# Altium project ESP32IOTProduct.PrjPcb (part 5 of 6)

## Sheet GPIOs_Expander_Relay_Sheet.SchDoc
size A4; SheetNumber: 9; SheetTotal: 10
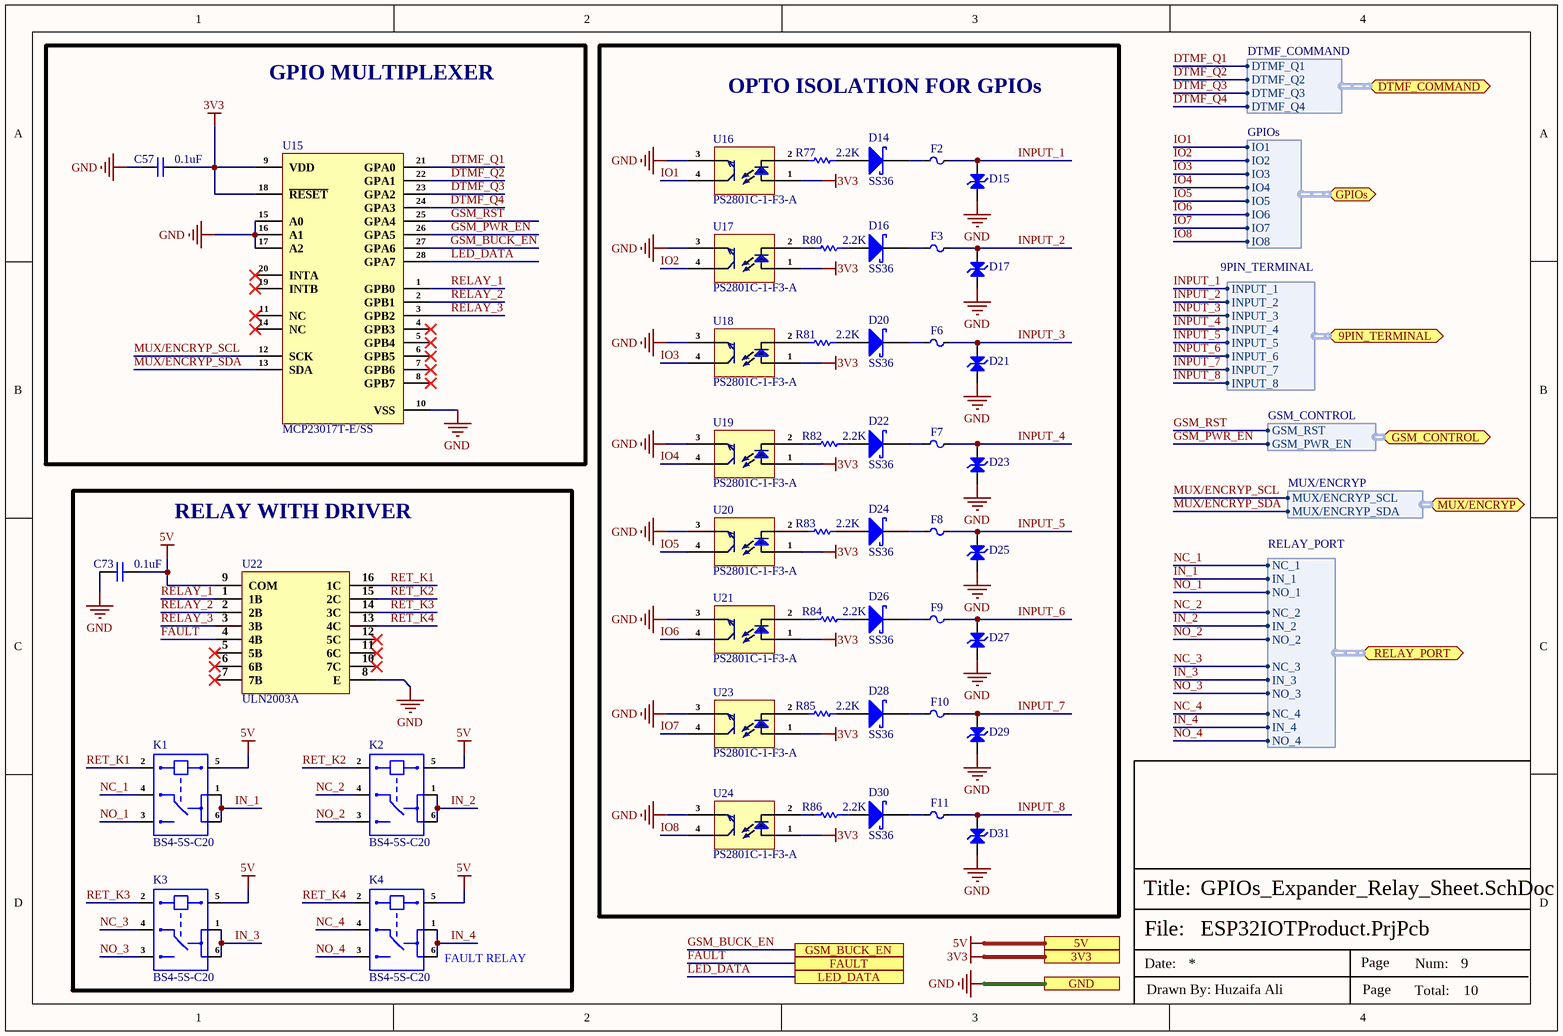
[diagram p8: GPIOs_Expander_Relay_Sheet.SchDoc]

### Parts
C57  0.1uF  [Cap-0603]
C73  0.1uF  [Cap-0603]
D14  SS36  [SMA]
D15  SMBJ36CA  [SMB_]  (value not drawn)
D16  SS36  [SMA]
D17  SMBJ36CA  [SMB_]  (value not drawn)
D20  SS36  [SMA]
D21  SMBJ36CA  [SMB_]  (value not drawn)
D22  SS36  [SMA]
D23  SMBJ36CA  [SMB_]  (value not drawn)
D24  SS36  [SMA]
D25  SMBJ36CA  [SMB_]  (value not drawn)
D26  SS36  [SMA]
D27  SMBJ36CA  [SMB_]  (value not drawn)
D28  SS36  [SMA]
D29  SMBJ36CA  [SMB_]  (value not drawn)
D30  SS36  [SMA]
D31  SMBJ36CA  [SMB_]  (value not drawn)
F2  BSMD1812-150-33V  [Fuse-1812_]  (value not drawn)
F3  BSMD1812-150-33V  [Fuse-1812_]  (value not drawn)
F6  BSMD1812-150-33V  [Fuse-1812_]  (value not drawn)
F7  BSMD1812-150-33V  [Fuse-1812_]  (value not drawn)
F8  BSMD1812-150-33V  [Fuse-1812_]  (value not drawn)
F9  BSMD1812-150-33V  [Fuse-1812_]  (value not drawn)
F10  BSMD1812-150-33V  [Fuse-1812_]  (value not drawn)
F11  BSMD1812-150-33V  [Fuse-1812_]  (value not drawn)
K1  BS4-5S-C20  [BS4-5S-C20]
K2  BS4-5S-C20  [BS4-5S-C20]
K3  BS4-5S-C20  [BS4-5S-C20]
K4  BS4-5S-C20  [BS4-5S-C20]
R77  2.2K  [Res-0603]
R80  2.2K  [Res-0603]
R81  2.2K  [Res-0603]
R82  2.2K  [Res-0603]
R83  2.2K  [Res-0603]
R84  2.2K  [Res-0603]
R85  2.2K  [Res-0603]
R86  2.2K  [Res-0603]
U15  MCP23017T-E/SS  [SSOP-28-208mil]
U16  PS2801C-1-F3-A  [SOP-4_1.27]
U17  PS2801C-1-F3-A  [SOP-4_1.27]
U18  PS2801C-1-F3-A  [SOP-4_1.27]
U19  PS2801C-1-F3-A  [SOP-4_1.27]
U20  PS2801C-1-F3-A  [SOP-4_1.27]
U21  PS2801C-1-F3-A  [SOP-4_1.27]
U22  ULN2003A  [SOP-16_150mil]
U23  PS2801C-1-F3-A  [SOP-4_1.27]
U24  PS2801C-1-F3-A  [SOP-4_1.27]

### Blocks framed on the sheet
GPIO MULTIPLEXER: C57 U15
OPTO ISOLATION FOR GPIOs: D14-D17 D20-D31 F2 F3 F6-F11 R77 R80-R86 U16-U21 U23 U24
RELAY WITH DRIVER: C73 K1-K4 U22

### Ports
3V3, 5V, 9PIN_TERMINAL (bidir, harness 9PIN_TERMINAL), DTMF_COMMAND (bidir, harness DTMF_COMMAND), FAULT, GND, GPIOs (bidir, harness GPIOs), GSM_BUCK_EN, GSM_CONTROL (bidir, harness GSM_CONTROL), LED_DATA, MUX/ENCRYP (bidir, harness MUX/ENCRYP), RELAY_PORT (bidir, harness RELAY_PORT)

### Harnesses
GPIOs: IO1, IO2, IO3, IO4, IO5, IO6, IO7, IO8
DTMF_COMMAND: DTMF_Q1, DTMF_Q2, DTMF_Q3, DTMF_Q4
GSM_CONTROL: GSM_RST, GSM_PWR_EN
9PIN_TERMINAL: INPUT_1, INPUT_2, INPUT_3, INPUT_4, INPUT_5, INPUT_6, INPUT_7, INPUT_8
RELAY_PORT: NC_1, NC_2, IN_1, IN_2, NO_1, NO_2, NC_3, NC_4, IN_3, IN_4, NO_3, NO_4
MUX/ENCRYP: MUX/ENCRYP_SCL, MUX/ENCRYP_SDA

### Nets
3V3: C57.1 U15.9(VDD) U15.18(~{RESET}) U16.1(An) U17.1(An) U18.1(An) U19.1(An) U20.1(An) U21.1(An) U23.1(An) U24.1(An) ; port 3V3
5V: C73.1 K1.5 K2.5 K3.5 K4.5 U22.9(COM) ; port 5V
GND: C57.2 C73.2 D15.1(A) D17.1(A) D21.1(A) D23.1(A) D25.1(A) D27.1(A) D29.1(A) D31.1(A) U15.10(VSS) U15.15(A0) U15.16(A1) U15.17(A2) U16.3(E) U17.3(E) U18.3(E) U19.3(E) U20.3(E) U21.3(E) U22.8(E) U23.3(E) U24.3(E) ; port GND
DTMF_Q1: U15.21(GPA0) ; port DTMF_COMMAND.DTMF_Q1
DTMF_Q2: U15.22(GPA1) ; port DTMF_COMMAND.DTMF_Q2
DTMF_Q3: U15.23(GPA2) ; port DTMF_COMMAND.DTMF_Q3
DTMF_Q4: U15.24(GPA3) ; port DTMF_COMMAND.DTMF_Q4
FAULT: U22.4(4B) ; port FAULT
GSM_BUCK_EN: U15.27(GPA6) ; port GSM_BUCK_EN
GSM_PWR_EN: U15.26(GPA5) ; port GSM_CONTROL.GSM_PWR_EN
GSM_RST: U15.25(GPA4) ; port GSM_CONTROL.GSM_RST
IN_1: K1.1 K1.6 ; port RELAY_PORT.IN_1
IN_2: K2.1 K2.6 ; port RELAY_PORT.IN_2
IN_3: K3.1 K3.6 ; port RELAY_PORT.IN_3
IN_4: K4.1 K4.6 ; port RELAY_PORT.IN_4
INPUT_1: D15.2(K) F2.2 ; port 9PIN_TERMINAL.INPUT_1
INPUT_2: D17.2(K) F3.2 ; port 9PIN_TERMINAL.INPUT_2
INPUT_3: D21.2(K) F6.2 ; port 9PIN_TERMINAL.INPUT_3
INPUT_4: D23.2(K) F7.2 ; port 9PIN_TERMINAL.INPUT_4
INPUT_5: D25.2(K) F8.2 ; port 9PIN_TERMINAL.INPUT_5
INPUT_6: D27.2(K) F9.2 ; port 9PIN_TERMINAL.INPUT_6
INPUT_7: D29.2(K) F10.2 ; port 9PIN_TERMINAL.INPUT_7
INPUT_8: D31.2(K) F11.2 ; port 9PIN_TERMINAL.INPUT_8
IO1: U16.4(C) ; port GPIOs.IO1
IO2: U17.4(C) ; port GPIOs.IO2
IO3: U18.4(C) ; port GPIOs.IO3
IO4: U19.4(C) ; port GPIOs.IO4
IO5: U20.4(C) ; port GPIOs.IO5
IO6: U21.4(C) ; port GPIOs.IO6
IO7: U23.4(C) ; port GPIOs.IO7
IO8: U24.4(C) ; port GPIOs.IO8
LED_DATA: U15.28(GPA7) ; port LED_DATA
MUX/ENCRYP_SCL: U15.12(SCK) ; port MUX/ENCRYP.MUX/ENCRYP_SCL
MUX/ENCRYP_SDA: U15.13(SDA) ; port MUX/ENCRYP.MUX/ENCRYP_SDA
NC_1: K1.4 ; port RELAY_PORT.NC_1
NC_2: K2.4 ; port RELAY_PORT.NC_2
NC_3: K3.4 ; port RELAY_PORT.NC_3
NC_4: K4.4 ; port RELAY_PORT.NC_4
NO_1: K1.3 ; port RELAY_PORT.NO_1
NO_2: K2.3 ; port RELAY_PORT.NO_2
NO_3: K3.3 ; port RELAY_PORT.NO_3
NO_4: K4.3 ; port RELAY_PORT.NO_4
RELAY_1: U15.1(GPB0) U22.1(1B)
RELAY_2: U15.2(GPB1) U22.2(2B)
RELAY_3: U15.3(GPB2) U22.3(3B)
RET_K1: K1.2 U22.16(1C)
RET_K2: K2.2 U22.15(2C)
RET_K3: K3.2 U22.14(3C)
RET_K4: K4.2 U22.13(4C)
NetD14_1: D14.1(K) F2.1
NetD14_2: D14.2(A) R77.2
NetD16_1: D16.1(K) F3.1
NetD16_2: D16.2(A) R80.2
NetD20_1: D20.1(K) F6.1
NetD20_2: D20.2(A) R81.2
NetD22_1: D22.1(K) F7.1
NetD22_2: D22.2(A) R82.2
NetD24_1: D24.1(K) F8.1
NetD24_2: D24.2(A) R83.2
NetD26_1: D26.1(K) F9.1
NetD26_2: D26.2(A) R84.2
NetD28_1: D28.1(K) F10.1
NetD28_2: D28.2(A) R85.2
NetD30_1: D30.1(K) F11.1
NetD30_2: D30.2(A) R86.2
NetR77_1: R77.1 U16.2(Ca)
NetR80_1: R80.1 U17.2(Ca)
NetR81_1: R81.1 U18.2(Ca)
NetR82_1: R82.1 U19.2(Ca)
NetR83_1: R83.1 U20.2(Ca)
NetR84_1: R84.1 U21.2(Ca)
NetR85_1: R85.1 U23.2(Ca)
NetR86_1: R86.1 U24.2(Ca)

Not connected (* = marked no-connect by the designer): U15 4(GPB3)* 5(GPB4)* 6(GPB5)* 7(GPB6)* 8(GPB7)* 11(NC)* 14(NC)* 19(INTB)* 20(INTA)*; U22 5(5B)* 6(6B)* 7(7B)* 10(7C)* 11(6C)* 12(5C)*

### Notes on the sheet
- (near K4) FAULT RELAY
- File:
- Title:
- Date:
- Page
- Num:
- Total:
- Drawn By: Huzaifa Ali

### Library data of the parts
C57 C73 = CC0603KRX5R9BB104: CAP CER 0.1UF 50V X5R 0603; Manufacturer: Yageo; Capacitance: 100nF; Tolerance: 10%; Item Type: Capacitor; Supplier 1: Digi-Key; Manufacturer Part Number: CC0603KRX5R9BB104; RoHS: Yes; Category: Ceramic Capacitors; Stock 1: 152253; Pricing 1: 1=0.10000, 10=0.05200, 50=0.02820, 100=0.02310, 500=0.01648, 1000=0.01294 (USD); Mount: Surface Mount; Case/Package: 0603; Case Code (Imperial): 0603; Case Code (Metric): 1608; Weight: 7.1E-05oz; Min Operating Temperature: -55°C; Max Operating Temperature: 85°C; Packaging: Tape and Reel; Voltage Rating: 50V; Dielectric: X5R; Termination: SMD/SMT; Voltage Rating (DC): 50V; Package Quantity: 4000; Length: 0.063inch; Width: 0.031inch; Thickness: 0.035inch; Lead Free: Lead Free; Halogen Free: Halogen Free; ComponentLink1URL: http://www.mouser.com/ds/2/447/Yageo_UPY-GP_NP0_16V-to-50V_9-358835.pdf?src-supplier=Mouser; ComponentLink1Description: http://www.mouser.com/ds/2/447/Yageo_UPY-GP_NP0_16V-to-50V_9-358835.pdf?src-supplier=Mouser; ComponentLink2URL: https://www.yageo.com/upload/media/product/productsearch/datasheet/mlcc/UPY-GPHC_X5R_4V-to-50V_26.pdf?src-supplier=Digi-Key; ComponentLink2Description: https://www.yageo.com/upload/media/product/productsearch/datasheet/mlcc/UPY-GPHC_X5R_4V-to-50V_26.pdf?src-supplier=Digi-Key; ComponentLink3URL: http://www.yageo.com/exep/pages/download/literatures/ProductSelectionGuide%202014_Final_2.pdf?src-supplier=Digi-Key; ComponentLink3Description: http://www.yageo.com/exep/pages/download/literatures/ProductSelectionGuide%202014_Final_2.pdf?src-supplier=Digi-Key; Supplier Part Number 1: 311-4046-1-ND; LCSC Part Number: C110022
D14 D16 D20 D22 D24 D26 D28 D30 = SS36: Schottky Barrier Diode SK36, DO-214AB, 3A/60V; Manufacturer: ON Semiconductor / Fairchild; Output Current: 3A; Element Configuration: Single; Forward Voltage: 750mV; Max Repetitive Reverse Voltage (Vrrm): 60V; Max Forward Surge Current (Ifsm): 100A; Max Reverse Current: 500uA; Polarity: Standard; Power Dissipation: 2.27W; Supplier 1: Rs; Manufacturer Part Number: SS36; RoHS: Yes; Category: Schottky Diodes; Stock 1: 100; Pricing 1: 100=0.43800, 500=0.34200, 1000=0.27800, 3000=0.25000 (GBP); Mount: Surface Mount; Case/Package: SMC; Number of Pins: 2; Min Operating Temperature: -55°C; Max Operating Temperature: 150°C; Packaging: Tape and Reel; Package Quantity: 3000; Series: -; Forward Current: 3A; Peak Non-Repetitive Surge Current: 100A; Voltage Rating (DC): 60V; Current Rating: 3A; Max Surge Current: 100A; Average Rectified Current: 3A; Max Reverse Leakage Current: 500uA; Max Reverse Voltage (DC): 60V; Current: 3A; Voltage: 60V; Radiation Hardening: No; RoHS Compliant: Yes; Reach SVHC Compliant: Yes; Lead Free: Lead Free; ComponentLink1URL: https://datasheet.ciiva.com/4714/ss36-197193-4714610.pdf?src-supplier=Mouser; ComponentLink1Description: https://datasheet.ciiva.com/4714/ss36-197193-4714610.pdf?src-supplier=Mouser; ComponentLink2URL: https://datasheet.ciiva.com/16889/ss36-16889545.pdf?src-supplier=Future+Electronics; ComponentLink2Description: https://datasheet.ciiva.com/16889/ss36-16889545.pdf?src-supplier=Future+Electronics; ComponentLink3URL: https://datasheet.ciiva.com/920/ss34-920433.pdf?src-supplier=Digi-Key; ComponentLink3Description: https://datasheet.ciiva.com/920/ss34-920433.pdf?src-supplier=Digi-Key; ComponentLink4URL: https://datasheet.ciiva.com/920/ss34-920434.pdf?src-supplier=Digi-Key; ComponentLink4Description: https://datasheet.ciiva.com/920/ss34-920434.pdf?src-supplier=Digi-Key; ComponentLink5URL: https://datasheet.ciiva.com/920/ss34-920435.pdf?src-supplier=Digi-Key; ComponentLink5Description: https://datasheet.ciiva.com/920/ss34-920435.pdf?src-supplier=Digi-Key; Supplier Part Number 1: 9034425P; LCSC Part Number: C16015; Item Type: Diode
D15 D17 D21 D23 D25 D27 D29 D31 = SMBJ36CA: 58.1V 40V 36V Bi-Directional SMB(DO-214AA) TVS ROHS; Manufacturer: Slkor(SLKORMICRO Elec.); Item Type: Diode; Manufacturer Part Number: SMBJ36CA; Package: SMB(DO-214AA); LCSC Part Number: C556189; ComponentLink1Description: LCSC; ComponentLink1URL: https://www.lcsc.com/product-detail/span-style-background-color-ff0-TVS-span_Slkor-SLKORMICRO-Elec-SMBJ36CA_C556189.html
F2 F3 F6-F11 = BSMD1812-150-33V: 33V 1.5A 40A 3A 1812 Resettable Fuses ROHS; Manufacturer: BHFUSE; Item Type: Fuse; Manufacturer Part Number: BSMD1812-150-33V; Package: 1812; LCSC Part Number: C883154; ComponentLink1Description: LCSC; ComponentLink1URL: https://www.lcsc.com/product-detail/Resettable-Fuses_BHFUSE-BSMD1812-150-33V_C883154.html
K1-K4 = BS4-5S-C20: 5V SPDT (1 Form C) 6 DIP,11x15.5mm Power Relays ROHS; Manufacturer: NBC; Item Type: Relay; Manufacturer Part Number: BS4-5S-C20; Package: DIP,11x15.5mm; LCSC Part Number: C396938; ComponentLink1Description: LCSC; ComponentLink1URL: https://www.lcsc.com/product-detail/Power-Relays_NBC-BS4-5S-C20_C396938.html
R77 R80-R86 = RC0603FR-072K2L: RES 2.2K OHM 1% 1/10W 0603; Manufacturer: Yageo; Resistance: 2.2kR; Temperature Coefficient: 100ppm/°C; Power Rating: 100mW; Voltage Rating: 50V; Item Type: Resistor; Supplier 1: Avnet; Manufacturer Part Number: RC0603FR-072K2L; RoHS: Yes; Category: Chip SMD Resistors; Stock 1: 733100; Pricing 1: 5000=0.00133, 10000=0.00131, 20000=0.00127 (USD); Case/Package: 0603; Case Code (Imperial): 0603; Case Code (Metric): 1608; Size Code: 0603; Min Operating Temperature: -55°C; Max Operating Temperature: 155°C; Tolerance: 1%; Packaging: Tape and Reel; Resistor Type: Thick Film; Package Quantity: 1; Termination: SMD/SMT; Number of Terminations: 2; Max Power Dissipation: 100mW; Features: Moisture Resistant; Series: RC; Resistance Tolerance: 1%; Construction: Rectangular; Length: 1.6mm; Width: 0.031inch; Height: 0.022inch; Depth: 0.8mm; Lead Free: Lead Free; Military Standard: Not; RoHS Compliant: Yes; Supplier Part Number 1: RC0603FR-072K2L; LCSC Part Number: C114662
U15 = MCP23017T-E/SS: IC XPNDR 1.7MHZ I2C 28SSOP; Manufacturer: Microchip; Operating Supply Voltage: 5.5V; Interface: I2C,Serial; Number of Channels: 1; Output Current: 25mA; Number of I/Os: 16; Power Dissipation: 700mW; Clock Frequency: 10MHz; Output Type: PUSH-PULL; Supply Current: 1mA; Supplier 1: Digi-Key; Manufacturer Part Number: MCP23017T-E/SS; RoHS: Yes; Category: Interface ICs; Stock 1: 26314; Pricing 1: 1=1.69, 25=1.4, 100=1.28 (USD); Mounting Technology: Surface Mount; Case/Package: SSOP; Pins: 28; Min Operating Temperature: -40°C; Max Operating Temperature: 125°C; Package Quantity: 2100; Series: -; Packaging: Tape and Reel; Frequency: 1.7MHz; Number of Bits: 16; Nominal Supply Voltage: 5.5V; Lead Free: Lead Free; RoHS Compliant: Yes; ComponentLink1URL: https://datasheet.ciiva.com/12267/21952b-12267583.pdf?src-supplier=Mouser; ComponentLink1Description: https://datasheet.ciiva.com/12267/21952b-12267583.pdf?src-supplier=Mouser; ComponentLink2URL: https://datasheet.ciiva.com/8128/21952b-8128586.pdf?src-supplier=Avnet; ComponentLink2Description: https://datasheet.ciiva.com/8128/21952b-8128586.pdf?src-supplier=Avnet; ComponentLink3URL: https://datasheet.ciiva.com/16454/filehandler-aspxddocname-en023709-16454267.pdf?src-supplier=Future+Electronics; ComponentLink3Description: https://datasheet.ciiva.com/16454/filehandler-aspxddocname-en023709-16454267.pdf?src-supplier=Future+Electronics; ComponentLink4URL: https://datasheet.ciiva.com/1780/21952b-1780738.pdf?src-supplier=Digi-Key; ComponentLink4Description: https://datasheet.ciiva.com/1780/21952b-1780738.pdf?src-supplier=Digi-Key; Supplier Part Number 1: MCP23017T-E/SSCT-ND; LCSC Part Number: C558584; Item Type: IC
U16-U21 U23 U24 = PS2801C-1-F3-A: TransistorOptocouplers DC 1 2500Vrms SOP-4_P1.27 Optocouplers RoHS; Manufacturer: RENESAS; Manufacturer Part Number: PS2801C-1-F3-A; ComponentLink1Description: LCSC; ComponentLink1URL: https://www.lcsc.com/product-detail/Optocouplers-Phototransistor-Output_RENESAS-PS2801C-1-F3-A_C67112.html; LCSC Part Number: C67112
U22 = ULN2003A: 100uA@50V 3V@2V,300mA 1.6V@350mA 4mA@12V 100uA@50V 1.25V@350mA 500mA 25pF SOP-16_150mil Darlington Transistor Arrays ROHS; Manufacturer: Mixic; Item Type: IC; Manufacturer Part Number: ULN2003A; Package: SOP-16_150mil; LCSC Part Number: C181730; ComponentLink1Description: LCSC; ComponentLink1URL: https://www.lcsc.com/product-detail/Darlington-Transistor-Arrays_Mixic-ULN2003A_C181730.html